# Altium schematic sheet Sheet_1_2026-10-25.schdoc
size 275 x 92 mm
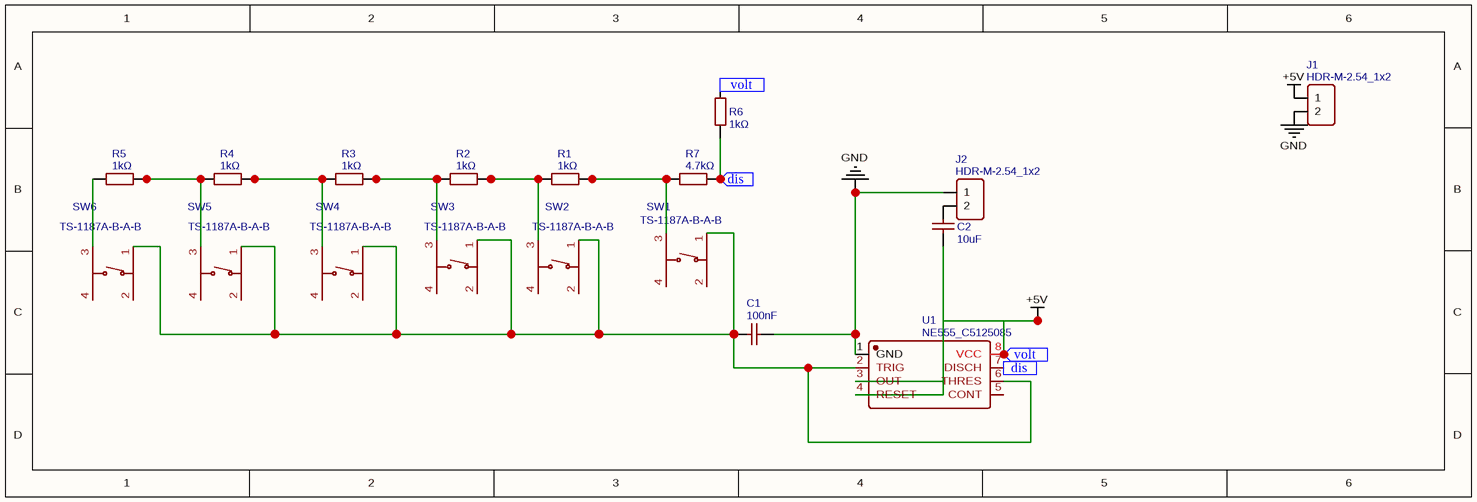
[diagram p0: Sheet_1_2026-10-25.schdoc]

## Parts
C1  100nF  [C0805]
C2  10uF  [C1206]
J1  HDR-M-2.54_1x2  [HDR-M-2.54_1X2]
J2  HDR-M-2.54_1x2  [HDR-M-2.54_1X2]
R1  1kΩ  [R0805]
R2  1kΩ  [R0805]
R3  1kΩ  [R0805]
R4  1kΩ  [R0805]
R5  1kΩ  [R0805]
R6  1kΩ  [R0805]
R7  4.7kΩ  [R0805]
SW1  TS-1187A-B-A-B  [SW-SMD_4P-L5.1-W5.1-P3.70-LS6.5-TL_H1.5]
SW2  TS-1187A-B-A-B  [SW-SMD_4P-L5.1-W5.1-P3.70-LS6.5-TL_H1.5]
SW3  TS-1187A-B-A-B  [SW-SMD_4P-L5.1-W5.1-P3.70-LS6.5-TL_H1.5]
SW4  TS-1187A-B-A-B  [SW-SMD_4P-L5.1-W5.1-P3.70-LS6.5-TL_H1.5]
SW5  TS-1187A-B-A-B  [SW-SMD_4P-L5.1-W5.1-P3.70-LS6.5-TL_H1.5]
SW6  TS-1187A-B-A-B  [SW-SMD_4P-L5.1-W5.1-P3.70-LS6.5-TL_H1.5]
U1  NE555_C5125085  [SOIC-8_L4.9-W3.9-P1.27-LS6.0-BL]

## Ports
dis (in), volt (in)

## Nets
+5V: C2.1 J1.1 R6.2 U1.3(OUT) U1.4(RESET) U1.8(VCC) ; port volt
GND: C1.2 J1.2 J2.1 U1.1(GND)
dis: R6.1 R7.2 U1.7(DISCH) ; port dis
NetC1_1: C1.1 SW1.1(A) SW2.1(A) SW3.1(A) SW4.1(A) SW5.1(A) SW6.1(A) U1.2(TRIG) U1.6(THRES)
NetC2_2: C2.2 J2.2
NetR1_1: R1.1 R2.2 SW2.3(C)
NetR1_2: R1.2 R7.1 SW1.3(C)
NetR2_1: R2.1 R3.2 SW3.3(C)
NetR3_1: R3.1 R4.2 SW4.3(C)
NetR4_1: R4.1 R5.2 SW5.3(C)
NetR5_1: R5.1 SW6.3(C)

Not connected (* = marked no-connect by the designer): SW1 2(B) 4(D); SW2 2(B) 4(D); SW3 2(B) 4(D); SW4 2(B) 4(D); SW5 2(B) 4(D); SW6 2(B) 4(D); U1 5(CONT)

## Library data of the parts
C1 = 100nF: Manufacturer: FH(风华); Manufacturer Part: 0805B104K500NT; nameAlias: Value; Supplier: LCSC; Supplier Part: C38141; JLCPCB Part Class: Extended Part; spicePre: C; spiceSymbolName: 0805B104K500NT
C2 = 10uF: Manufacturer Part: CL31A106KBHNNNE; Manufacturer: SAMSUNG(三星); nameAlias: Value; Supplier: LCSC; Supplier Part: C13585; JLCPCB Part Class: Basic Part; spicePre: C; spiceSymbolName: CL31A106KBHNNNE
J1 J2 = HDR-M-2.54_1x2: Contributor: LCEDA_Lib; Supplier Part: C124375; Supplier: LCSC; spicePre: J; spiceSymbolName: HDR-M-2.54_1x2
R1-R6 = 1kΩ: Manufacturer: UNI-ROYAL(厚声); Manufacturer Part: 0805W8F1001T5E; nameAlias: Value; Supplier: LCSC; Supplier Part: C17513; JLCPCB Part Class: Basic Part; spicePre: R; spiceSymbolName: 0805W8F1001T5E
R7 = 4.7kΩ: Manufacturer: UNI-ROYAL(厚声); Manufacturer Part: 0805W8F4701T5E; nameAlias: Value; Supplier: LCSC; Supplier Part: C17673; JLCPCB Part Class: Basic Part; spicePre: R; spiceSymbolName: 0805W8F4701T5E
SW1-SW6 = TS-1187A-B-A-B: Manufacturer: XKB Connection(中国星坤); Contributor: LCSC; Supplier: LCSC; Supplier Part: C318884; Manufacturer Part: TS-1187A-B-A-B; JLCPCB Part Class: Basic Part; spicePre: S; spiceSymbolName: TS-1187A-B-A-B
U1 = NE555_C5125085: Manufacturer: IDCHIP(英锐芯); Manufacturer Part: NE555; Contributor: lcsc; Supplier: LCSC; Supplier Part: C5125085; JLCPCB Part Class: Extended Part; spicePre: U; spiceSymbolName: NE555_C5125085